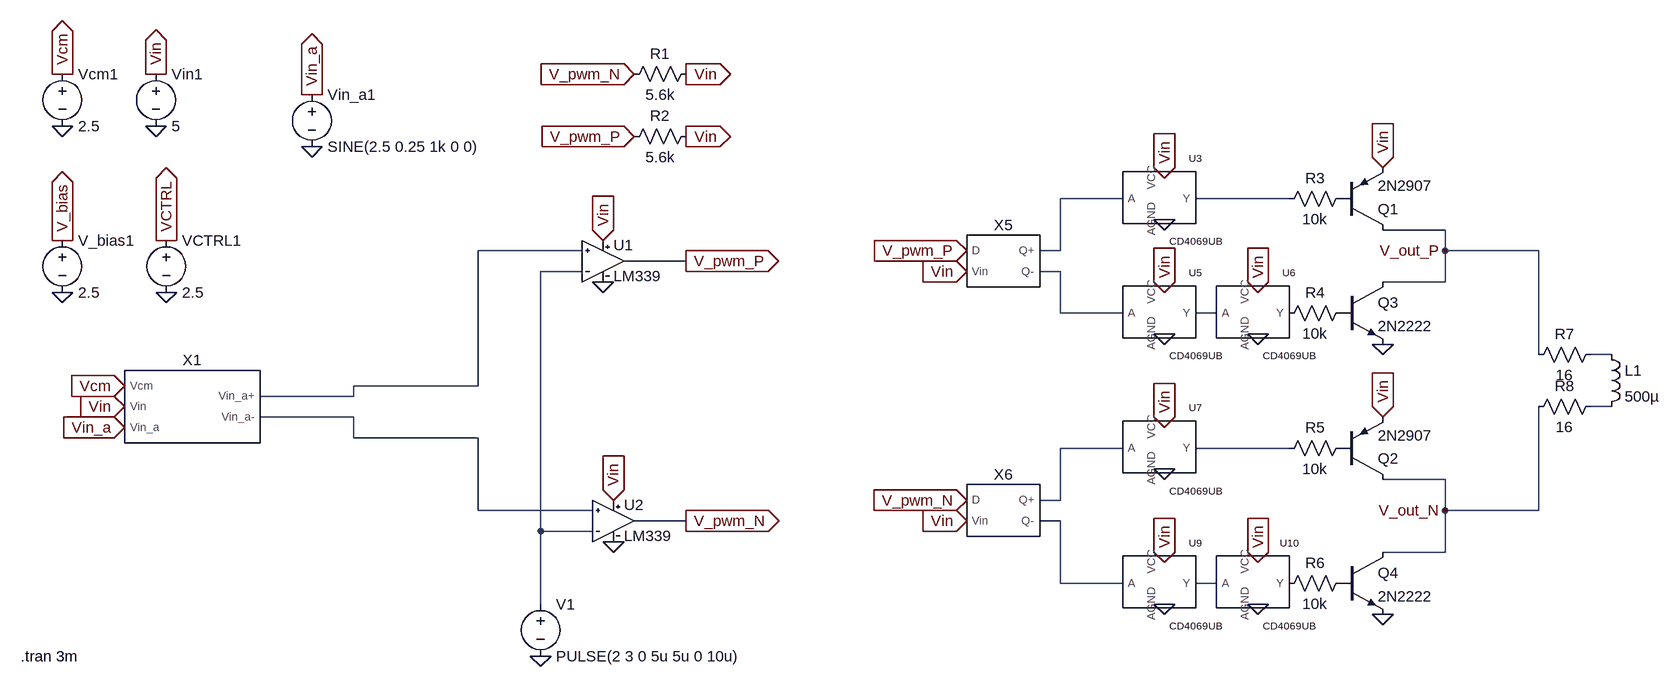
[diagram p0: schematic Exp5.asc]
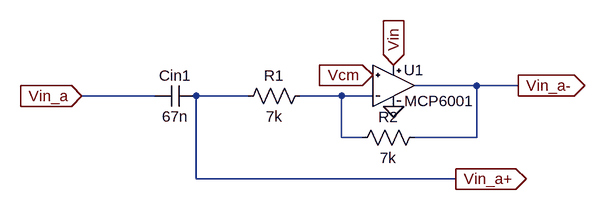
[diagram p1: sub-circuit exp4_block.asc]
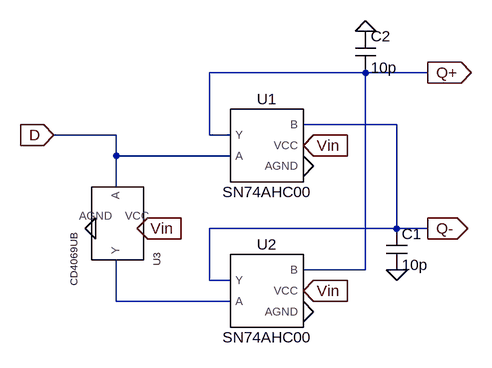
[diagram p2: sub-circuit exp5_non_overlap_generator.asc]
Exp5.asc, the LTspice schematic file:
Version 4.1
SHEET 1 1748 680
WIRE 912 -96 816 -96
WIRE 1168 -96 1024 -96
WIRE 1408 -48 1312 -48
WIRE 80 -16 -80 -16
WIRE 816 -16 816 -96
WIRE 816 -16 784 -16
WIRE 1408 -16 1408 -48
WIRE 1552 -16 1408 -16
WIRE 240 0 144 0
WIRE 80 16 16 16
WIRE 816 16 784 16
WIRE 1408 32 1408 -16
WIRE 1408 32 1312 32
WIRE 816 80 816 16
WIRE 912 80 816 80
WIRE 1056 80 1024 80
WIRE 1552 144 1552 -16
WIRE 1664 144 1632 144
WIRE -80 192 -80 -16
WIRE -80 192 -272 192
WIRE -272 208 -272 192
WIRE -272 208 -416 208
WIRE 1664 224 1632 224
WIRE -272 240 -416 240
WIRE -272 272 -272 240
WIRE -80 272 -272 272
WIRE 912 288 816 288
WIRE 1168 288 1024 288
WIRE 1408 336 1312 336
WIRE 816 368 816 288
WIRE 816 368 784 368
WIRE -80 384 -80 272
WIRE 96 384 -80 384
WIRE 1408 384 1408 336
WIRE 1552 384 1552 224
WIRE 1552 384 1408 384
WIRE 240 400 160 400
WIRE 816 400 784 400
WIRE 16 416 16 16
WIRE 96 416 16 416
WIRE 1408 448 1408 384
WIRE 1408 448 1312 448
WIRE 816 496 816 400
WIRE 912 496 816 496
WIRE 1056 496 1024 496
WIRE 16 528 16 416
FLAG -720 -288 Vcm
IOPIN -720 -288 Out
FLAG -720 -208 0
FLAG -576 -288 Vin
IOPIN -576 -288 Out
FLAG -576 -208 0
FLAG -720 -32 V_bias
IOPIN -720 -32 Out
FLAG -720 48 0
FLAG -560 48 0
FLAG -560 -32 VCTRL
IOPIN -560 -32 Out
FLAG -336 -176 0
FLAG -336 -256 Vin_a
IOPIN -336 -256 Out
FLAG 240 0 V_pwm_P
IOPIN 240 0 Out
FLAG 240 400 V_pwm_N
IOPIN 240 400 Out
FLAG 128 432 0
FLAG 112 32 0
FLAG 112 -32 Vin
IOPIN 112 -32 In
FLAG 128 368 Vin
IOPIN 128 368 In
FLAG 160 -192 V_pwm_P
IOPIN 160 -192 In
FLAG 160 -288 V_pwm_N
IOPIN 160 -288 In
FLAG 240 -288 Vin
IOPIN 240 -288 Out
FLAG 240 -192 Vin
IOPIN 240 -192 Out
FLAG 672 16 Vin
IOPIN 672 16 In
FLAG 672 400 Vin
IOPIN 672 400 In
FLAG 672 -16 V_pwm_P
IOPIN 672 -16 In
FLAG 672 368 V_pwm_N
IOPIN 672 368 In
FLAG 976 -128 Vin
IOPIN 976 -128 In
FLAG 976 48 Vin
IOPIN 976 48 In
FLAG 1120 48 Vin
IOPIN 1120 48 In
FLAG 976 256 Vin
IOPIN 976 256 In
FLAG 976 464 Vin
IOPIN 976 464 In
FLAG 1120 464 Vin
IOPIN 1120 464 In
FLAG 1312 128 0
FLAG 1312 544 0
FLAG 1312 -144 Vin
IOPIN 1312 -144 In
FLAG 1312 240 Vin
IOPIN 1312 240 In
FLAG -624 256 Vin_a
IOPIN -624 256 In
FLAG -624 224 Vin
IOPIN -624 224 In
FLAG -624 192 Vcm
IOPIN -624 192 In
FLAG 976 -64 0
FLAG 976 112 0
FLAG 1120 112 0
FLAG 976 320 0
FLAG 976 528 0
FLAG 1120 528 0
FLAG 1408 -16 V_out_P
FLAG 1408 384 V_out_N
FLAG 16 608 0
SYMBOL Exp4_block -528 224 R0
SYMATTR InstName X1
SYMBOL voltage -720 -304 R0
SYMATTR InstName Vcm1
SYMATTR Value 2.5
SYMBOL voltage -576 -304 R0
SYMATTR InstName Vin1
SYMATTR Value 5
SYMBOL voltage -720 -48 R0
SYMATTR InstName V_bias1
SYMATTR Value 2.5
SYMBOL voltage -560 -48 R0
SYMATTR InstName VCTRL1
SYMATTR Value 2.5
SYMBOL voltage -336 -272 R0
WINDOW 123 0 0 Left 0
WINDOW 39 0 0 Left 0
SYMATTR InstName Vin_a1
SYMATTR Value SINE(2.5 0.25 1k 0 0)
SYMBOL LM339 144 0 R0
SYMATTR InstName U1
SYMBOL LM339 160 400 R0
SYMATTR InstName U2
SYMBOL res 256 -304 R90
WINDOW 0 0 56 VBottom 2
WINDOW 3 32 56 VTop 2
SYMATTR InstName R1
SYMATTR Value 5.6k
SYMBOL res 256 -208 R90
WINDOW 0 0 56 VBottom 2
WINDOW 3 32 56 VTop 2
SYMATTR InstName R2
SYMATTR Value 5.6k
SYMBOL CD4069UB 960 -96 R0
SYMATTR InstName U3
SYMBOL CD4069UB 960 80 R0
SYMATTR InstName U5
SYMBOL CD4069UB 1104 80 R0
SYMATTR InstName U6
SYMBOL CD4069UB 960 288 R0
SYMATTR InstName U7
SYMBOL CD4069UB 960 496 R0
SYMATTR InstName U9
SYMBOL CD4069UB 1104 496 R0
SYMATTR InstName U10
SYMBOL res 1264 -112 R90
WINDOW 0 0 56 VBottom 2
WINDOW 3 32 56 VTop 2
SYMATTR InstName R3
SYMATTR Value 10k
SYMBOL res 1264 64 R90
WINDOW 0 0 56 VBottom 2
WINDOW 3 32 56 VTop 2
SYMATTR InstName R4
SYMATTR Value 10k
SYMBOL res 1264 272 R90
WINDOW 0 0 56 VBottom 2
WINDOW 3 32 56 VTop 2
SYMATTR InstName R5
SYMATTR Value 10k
SYMBOL res 1264 480 R90
WINDOW 0 0 56 VBottom 2
WINDOW 3 32 56 VTop 2
SYMATTR InstName R6
SYMATTR Value 10k
SYMBOL npn 1248 32 R0
SYMATTR InstName Q3
SYMATTR Value 2N2222
SYMBOL npn 1248 448 R0
SYMATTR InstName Q4
SYMATTR Value 2N2222
SYMBOL pnp 1248 -48 M180
SYMATTR InstName Q1
SYMATTR Value 2N2907
SYMBOL pnp 1248 336 M180
SYMATTR InstName Q2
SYMATTR Value 2N2907
SYMBOL res 1536 160 R270
WINDOW 0 32 56 VTop 2
WINDOW 3 0 56 VBottom 2
SYMATTR InstName R7
SYMATTR Value 16
SYMBOL res 1536 240 R270
WINDOW 0 32 56 VTop 2
WINDOW 3 0 56 VBottom 2
SYMATTR InstName R8
SYMATTR Value 16
SYMBOL Exp5_non_overlap_generator 720 0 R0
SYMATTR InstName X5
SYMBOL Exp5_non_overlap_generator 720 384 R0
SYMATTR InstName X6
SYMBOL voltage 16 512 R0
WINDOW 123 0 0 Left 0
WINDOW 39 0 0 Left 0
SYMATTR InstName V1
SYMATTR Value PULSE(2 3 0 5u 5u 0 10u)
SYMBOL ind 1648 128 R0
SYMATTR InstName L1
SYMATTR Value 500µ
SYMATTR SpiceLine Rser=0
TEXT -784 608 Left 2 !.tran 3m

exp4_block.asc, the sub-circuit schematic file:
Version 4.1
SHEET 1 880 680
WIRE 416 128 320 128
WIRE 480 128 416 128
WIRE -80 144 -192 144
WIRE 64 144 -16 144
WIRE 208 144 144 144
WIRE 256 144 208 144
WIRE 208 208 208 144
WIRE 240 208 208 208
WIRE 416 208 416 128
WIRE 416 208 320 208
WIRE -16 272 -16 144
WIRE 384 272 -16 272
FLAG -192 144 Vin_a
IOPIN -192 144 In
FLAG 384 272 Vin_a+
IOPIN 384 272 Out
FLAG 480 128 Vin_a-
IOPIN 480 128 Out
FLAG 288 160 0
FLAG 256 112 Vcm
IOPIN 256 112 In
FLAG 288 96 Vin
IOPIN 288 96 In
SYMBOL cap -16 128 R90
WINDOW 0 0 32 VBottom 2
WINDOW 3 32 32 VTop 2
SYMATTR InstName Cin1
SYMATTR Value 67n
SYMBOL res 160 128 R90
WINDOW 0 0 56 VBottom 2
WINDOW 3 32 56 VTop 2
SYMATTR InstName R1
SYMATTR Value 7k
SYMBOL res 336 192 R90
WINDOW 0 0 56 VBottom 2
WINDOW 3 32 56 VTop 2
SYMATTR InstName R2
SYMATTR Value 7k
SYMBOL MCP6001 288 128 R0
SYMATTR InstName U1

exp5_non_overlap_generator.asc, the sub-circuit schematic file:
Version 4.1
SHEET 1 880 680
WIRE 208 -48 -32 -48
WIRE 304 -48 208 -48
WIRE 256 32 112 32
WIRE -176 48 -272 48
WIRE -32 48 -32 -48
WIRE 0 48 -32 48
WIRE -176 80 -176 48
WIRE 0 80 -176 80
WIRE -176 128 -176 80
WIRE 256 192 256 32
WIRE 256 192 -32 192
WIRE 304 192 256 192
WIRE 208 256 208 -48
WIRE 208 256 112 256
WIRE -32 272 -32 192
WIRE 0 272 -32 272
WIRE -176 304 -176 240
WIRE 0 304 -176 304
FLAG 208 -112 0
FLAG 256 256 0
FLAG 112 320 0
FLAG 112 96 0
FLAG -208 192 0
FLAG -272 48 D
IOPIN -272 48 In
FLAG -144 192 Vin
IOPIN -144 192 In
FLAG 304 -48 Q+
IOPIN 304 -48 Out
FLAG 304 192 Q-
IOPIN 304 192 Out
FLAG 112 64 Vin
IOPIN 112 64 In
FLAG 112 288 Vin
IOPIN 112 288 In
SYMBOL SN74AHC00 48 64 R0
SYMATTR InstName U1
SYMBOL SN74AHC00 48 288 R0
SYMATTR InstName U2
SYMBOL CD4069UB -176 176 R90
SYMATTR InstName U3
SYMBOL cap 240 192 R0
SYMATTR InstName C1
SYMATTR Value 10p
SYMBOL cap 192 -112 R0
SYMATTR InstName C2
SYMATTR Value 10p

The netlist it stands for:
* Exp5.asc
X§X1 Vcm Vin Vin_a N003 N009 exp4_block
Vcm1 Vcm 0 2.5
Vin1 Vin 0 5
V_bias1 V_bias 0 2.5
VCTRL1 VCTRL 0 2.5
Vin_a1 Vin_a 0 SINE(2.5 0.25 1k 0 0)
X§U1 N003 N004 Vin 0 V_pwm_P LM339
X§U2 N009 N004 Vin 0 V_pwm_N LM339
R1 Vin V_pwm_N 5.6k
R2 Vin V_pwm_P 5.6k
X§U3 N002 N001 Vin 0 CD4069UB  ; pins Y A VCC AGND
X§U5 N006 N005 Vin 0 CD4069UB  ; pins Y A VCC AGND
X§U6 P001 N006 Vin 0 CD4069UB  ; pins Y A VCC AGND
X§U7 N011 N010 Vin 0 CD4069UB  ; pins Y A VCC AGND
X§U9 N013 N012 Vin 0 CD4069UB  ; pins Y A VCC AGND
X§U10 P002 N013 Vin 0 CD4069UB  ; pins Y A VCC AGND
R3 P003 N002 10k
R4 P004 P001 10k
R5 P005 N011 10k
R6 P006 P002 10k
Q3 V_out_P P004 0 0 2N2222
Q4 V_out_N P006 0 0 2N2222
Q1 V_out_P P003 Vin 0 2N2907
Q2 V_out_N P005 Vin 0 2N2907
R7 V_out_P N007 16
R8 V_out_N N008 16
X§X5 V_pwm_P Vin N001 N005 exp5_non_overlap_generator
X§X6 V_pwm_N Vin N010 N012 exp5_non_overlap_generator
V1 N004 0 PULSE(2 3 0 5u 5u 0 10u)
L1 N007 N008 500µ Rser=0

* block symbol definitions
.subckt exp4_block Vcm Vin Vin_a Vin_a+ Vin_a-
Cin1 Vin_a+ Vin_a 67n
R1 N001 Vin_a+ 7k
R2 Vin_a- N001 7k
X§U1 Vcm N001 Vin 0 Vin_a- MCP6001
.ends exp4_block

.subckt exp5_non_overlap_generator D Vin Q+ Q-
X§U1 Q+ D Q- Vin 0 SN74AHC00  ; pins Y A B VCC AGND
X§U2 Q- N001 Q+ Vin 0 SN74AHC00  ; pins Y A B VCC AGND
X§U3 N001 D Vin 0 CD4069UB  ; pins Y A VCC AGND
C1 Q- 0 10p
C2 0 Q+ 10p
.ends exp5_non_overlap_generator

.model NPN NPN
.model PNP PNP
.lib standard.bjt
.tran 3m
.lib ./MCP6001.lib
.lib ./LM339.lib
.lib C:\Users\Saravanan\OneDrive\Documents\LTspice\CD4069UB.cir
.lib C:\Users\Saravanan\OneDrive\Documents\LTspice\SN74AHC00.cir
.backanno
.end